# Altium schematic sheet MPU - PWR.SchDoc
size A4; SheetNumber: 1; SheetTotal: 3
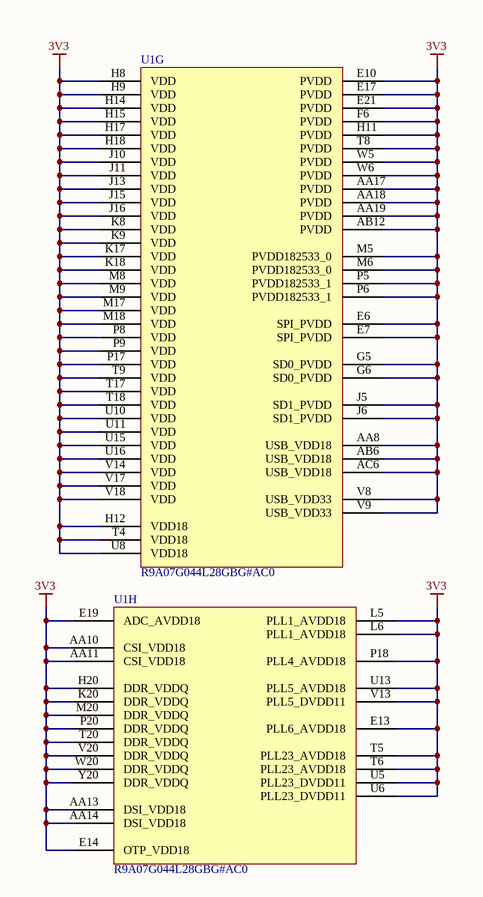
[diagram p0: MPU - PWR.SchDoc]

## Parts
U1  R9A07G044L28GBG#AC0  [R9A07G044L28GBG#AC0]  (parts G,H of 11)

## Nets
3V3: U1.AA8(USB_VDD18) U1.AA10(CSI_VDD18) U1.AA11(CSI_VDD18) U1.AA13(DSI_VDD18) U1.AA14(DSI_VDD18) U1.AA17(PVDD) U1.AA18(PVDD) U1.AA19(PVDD) U1.AB6(USB_VDD18) U1.AB12(PVDD) U1.AC6(USB_VDD18) U1.E6(SPI_PVDD) U1.E7(SPI_PVDD) U1.E10(PVDD) U1.E13(PLL6_AVDD18) U1.E14(OTP_VDD18) U1.E17(PVDD) U1.E19(ADC_AVDD18) U1.E21(PVDD) U1.F6(PVDD) U1.G5(SD0_PVDD) U1.G6(SD0_PVDD) U1.H8(VDD) U1.H9(VDD) U1.H11(PVDD) U1.H12(VDD18) U1.H14(VDD) U1.H15(VDD) U1.H17(VDD) U1.H18(VDD) U1.H20(DDR_VDDQ) U1.J5(SD1_PVDD) U1.J6(SD1_PVDD) U1.J10(VDD) U1.J11(VDD) U1.J13(VDD) U1.J15(VDD) U1.J16(VDD) U1.K8(VDD) U1.K9(VDD) U1.K17(VDD) U1.K18(VDD) U1.K20(DDR_VDDQ) U1.L5(PLL1_AVDD18) U1.L6(PLL1_AVDD18) U1.M5(PVDD182533_0) U1.M6(PVDD182533_0) U1.M8(VDD) U1.M9(VDD) U1.M17(VDD) U1.M18(VDD) U1.M20(DDR_VDDQ) U1.P5(PVDD182533_1) U1.P6(PVDD182533_1) U1.P8(VDD) U1.P9(VDD) U1.P17(VDD) U1.P18(PLL4_AVDD18) U1.P20(DDR_VDDQ) U1.T4(VDD18) U1.T5(PLL23_AVDD18) U1.T6(PLL23_AVDD18) U1.T8(PVDD) U1.T9(VDD) U1.T17(VDD) U1.T18(VDD) U1.T20(DDR_VDDQ) U1.U5(PLL23_DVDD11) U1.U6(PLL23_DVDD11) U1.U8(VDD18) U1.U10(VDD) U1.U11(VDD) U1.U13(PLL5_AVDD18) U1.U15(VDD) U1.U16(VDD) U1.V8(USB_VDD33) U1.V9(USB_VDD33) U1.V13(PLL5_DVDD11) U1.V14(VDD) U1.V17(VDD) U1.V18(VDD) U1.V20(DDR_VDDQ) U1.W5(PVDD) U1.W6(PVDD) U1.W20(DDR_VDDQ) U1.Y20(DDR_VDDQ)

## Library data of the parts
U1 = R9A07G044L28GBG#AC0: MPU RZ/G2L ARM Cortex-A55+/ARM Cortex-M33 RISC 64-Bit 1.2GHz 1.8V/3.3V 551-Pin BGA; Manufacturer Lifecycle Status: ACTIVE; Pitch: 800µm; Max Supply Voltage: 3.63V; Min Supply Voltage: 2.97V; RAM Size: 128kB; Number of USB Channels: 2; ComponentLink2Description: Datasheet URL; Mount: Surface Mount; ComponentLink2URL: https://octopart.com/cad-content/api/get-model-datasheet/15189/122020395; Height: 1.4mm; Export Control Classification Number (ECCN) Code: 3A991; Frequency: 1.2GHz; Max Frequency: 1.2GHz; ComponentLink1URL: http://www.renesas.com; Case/Package: BGA; Length: 21mm; Lifecycle Status: Production; ComponentLink3Description: Manufacturer's Package Drawing; Width: 21mm; China RoHS: Compliant; ComponentLink1Description: Manufacturer's Website; HelpURL: https://octopart.com/cad-content/api/get-model-datasheet/15189/122020395; RoHS: Compliant; Number of Pins: 551; ComponentLink3URL: https://www.renesas.com/en/document/psc/package-drawing-lfbga-551pin-plbg0551ga